# EAGLE design PortArrayModule_v2 (EAGLE 9.6.2)
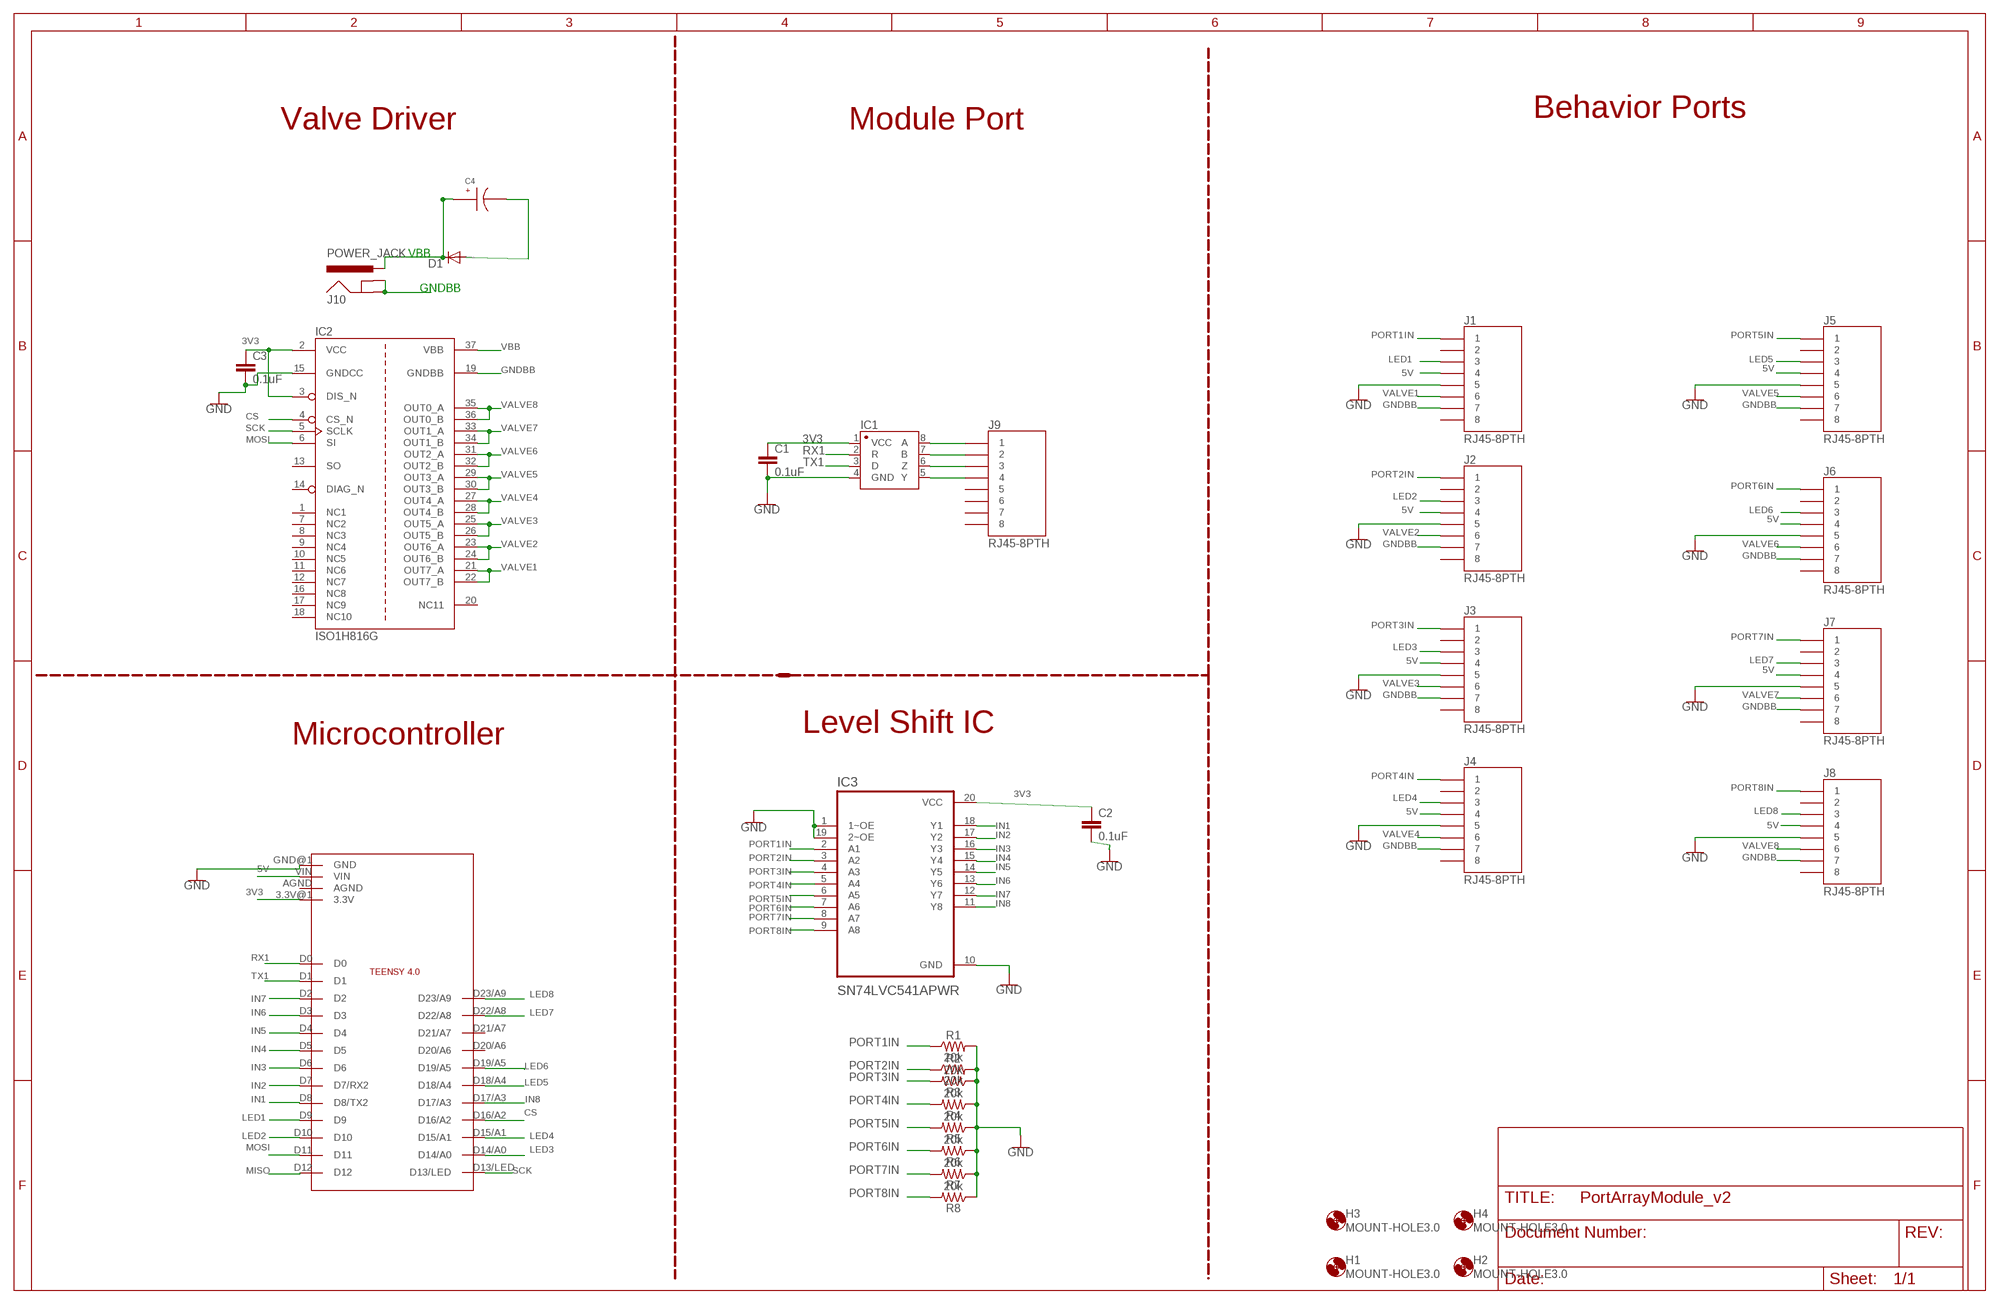
[diagram p0: schematic, sheet 1]

## Parts
C1  0.1uF  1.0UF-0805-25V-10%  [0805]
C2  0.1uF  1.0UF-0805-25V-10%  [0805]
C3  0.1uF  1.0UF-0805-25V-10%  [0805]
C4  EEE-FK1H100UR  [EEE-FK1H100UR]
D1  DIODE-DO214AA  [DO214AA]
H1  MOUNT-HOLE3.0  [3,0]
H2  MOUNT-HOLE3.0  [3,0]
H3  MOUNT-HOLE3.0  [3,0]
H4  MOUNT-HOLE3.0  [3,0]
IC1  SN65HVD31DR  [SO08]
IC2  ISO1H816G  [SOP65P1420X350-37N-1-V]
IC3  SN74LVC541APWR  [SOP65P640X120-20N]
J1  RJ45-8PTH  [RJ45-8]
J2  RJ45-8PTH  [RJ45-8]
J3  RJ45-8PTH  [RJ45-8]
J4  RJ45-8PTH  [RJ45-8]
J5  RJ45-8PTH  [RJ45-8]
J6  RJ45-8PTH  [RJ45-8]
J7  RJ45-8PTH  [RJ45-8]
J8  RJ45-8PTH  [RJ45-8]
J9  RJ45-8PTH  [RJ45-8]
J10  POWER_JACK  [POWER_JACK_PTH]
MC1  TEENSY4.0_SIMPLE_NO_VUSB  [TEENSY4.0_SIMPLE_NO_VUSB]
R1  20k  RESISTOR0805  [0805]
R2  20k  RESISTOR0805  [0805]
R3  20k  RESISTOR0805  [0805]
R4  20k  RESISTOR0805  [0805]
R5  20k  RESISTOR0805  [0805]
R6  20k  RESISTOR0805  [0805]
R7  20k  RESISTOR0805  [0805]
R8  20k  RESISTOR0805  [0805]

## Nets
3V3: C1.1 C2.1 C3.1 IC1.1(VCC) IC2.2(VCC) IC2.3(DIS_N) IC3.20(VCC) MC1.3.3V@1(3.3V)
5V: J1.4 J2.4 J3.4 J4.4 J5.4 J6.4 J7.4 J8.4 MC1.VIN
CS: IC2.4(CS_N) MC1.D16/A2
GND: C1.2 C2.2 C3.2 IC1.4(GND) IC2.15(GNDCC) IC3.1(1~OE) IC3.10(GND) IC3.19(2~OE) J1.5 J2.5 J3.5 J4.5 J5.5 J6.5 J7.5 J8.5 MC1.GND@1(GND) R1.2 R2.2 R3.1 R4.1 R5.1 R6.1 R7.1 R8.1
GNDBB: C4.CATHODE D1.A IC2.19(GNDBB) J1.7 J2.7 J3.7 J4.7 J5.7 J6.7 J7.7 J8.7 J10.GND J10.GNDBREAK
IN1: IC3.18(Y1) MC1.D8(D8/TX2)
IN2: IC3.17(Y2) MC1.D7(D7/RX2)
IN3: IC3.16(Y3) MC1.D6
IN4: IC3.15(Y4) MC1.D5
IN5: IC3.14(Y5) MC1.D4
IN6: IC3.13(Y6) MC1.D3
IN7: IC3.12(Y7) MC1.D2
IN8: IC3.11(Y8) MC1.D17/A3
LED1: J1.3 MC1.D9
LED2: J2.3 MC1.D10
LED3: J3.3 MC1.D14/A0
LED4: J4.3 MC1.D15/A1
LED5: J5.3 MC1.D18/A4
LED6: J6.3 MC1.D19/A5
LED7: J7.3 MC1.D22/A8
LED8: J8.3 MC1.D23/A9
MISO: MC1.D12
MOSI: IC2.6(SI) MC1.D11
N$6: IC1.6(Z) J9.3
N$7: IC1.5(Y) J9.4
N$8: IC1.8(A) J9.1
N$9: IC1.7(B) J9.2
PORT1IN: IC3.2(A1) J1.1 R1.1
PORT2IN: IC3.3(A2) J2.1 R2.1
PORT3IN: IC3.4(A3) J3.1 R3.2
PORT4IN: IC3.5(A4) J4.1 R4.2
PORT5IN: IC3.6(A5) J5.1 R5.2
PORT6IN: IC3.7(A6) J6.1 R6.2
PORT7IN: IC3.8(A7) J7.1 R7.2
PORT8IN: IC3.9(A8) J8.1 R8.2
RX1: IC1.2(R) MC1.D0
SCK: IC2.5(SCLK) MC1.D13/LED
TX1: IC1.3(D) MC1.D1
VALVE1: IC2.21(OUT7_A) IC2.22(OUT7_B) J1.6
VALVE2: IC2.23(OUT6_A) IC2.24(OUT6_B) J2.6
VALVE3: IC2.25(OUT5_A) IC2.26(OUT5_B) J3.6
VALVE4: IC2.27(OUT4_A) IC2.28(OUT4_B) J4.6
VALVE5: IC2.29(OUT3_A) IC2.30(OUT3_B) J5.6
VALVE6: IC2.31(OUT2_A) IC2.32(OUT2_B) J6.6
VALVE7: IC2.33(OUT1_A) IC2.34(OUT1_B) J7.6
VALVE8: IC2.35(OUT0_A) IC2.36(OUT0_B) J8.6
VBB: C4.ANODE D1.C IC2.37(VBB) J10.PWR
Unconnected: IC2.1(NC1) IC2.7(NC2) IC2.8(NC3) IC2.9(NC4) IC2.10(NC5) IC2.11(NC6) IC2.12(NC7) IC2.13(SO) IC2.14(DIAG_N) IC2.16(NC8) IC2.17(NC9) IC2.18(NC10) IC2.20(NC11) J1.2 J1.8 J2.2 J2.8 J3.2 J3.8 J4.2 J4.8 J5.2 J5.8 J6.2 J6.8 J7.2 J7.8 J8.2 J8.8 J9.5 J9.6 J9.7 J9.8 MC1.AGND MC1.D20/A6 MC1.D21/A7

## Notes on the sheet
- Behavior Ports
- Valve Driver | Module Port
- VBB
- GNDBB
- Level Shift IC
- Microcontroller

## Library data of the parts
C1-C3 = SparkFun-Capacitors:1.0UF: 1µF ceramic capacitors A capacitor is a passive two-terminal electrical component used to store electrical energy temporarily in an electric field.; PROD_ID: CAP-08064; VALUE: 1.0uF
C4 = JoshParts10:EEE-FK1H100UR
D1 = diode:DIODE-: DIODE
H1-H4 = holes:MOUNT-HOLE: MOUNTING HOLE with drill center marker
IC1 = Joshparts4:SN65HVD31DR: A placeholder for generic narrow & wide SOIC8 foorptints - used on the DIP adapter board.
IC2 = ISO1H816G:ISO1H816G: ISO1H816G Galvanic Isolated 8 Channel 1.2A High-Side Switch SOP65P1420X350-37N-1-V
IC3 = SN74LVC541APWR:SN74LVC541APWR
J1-J9 = SparkFun:RJ45-8: RJ45 Jack Simple RJ45, 8-pin connection - connector for common Cat5, Cat5e, and Cat6 Ethernet cables. Footprint not yet proven in production. Connector sku is PRT-00643; Breakout PCB sku is BOB-00716.
J10 = SparkFun-Connectors:POWER_JACK: Power Jack Connector This is the standard 5.5mm barrel jack for power. The PTH is the most common, proven, reliable, footprint. The Slot footprint only works if the mill layer is transmitted to the PCB fab house so be warned. Here are the connectors we sell at SparkFun: DC Barrel Power Jack/Connector <https://www.sparkfun.com/products/119> (PRT-00119) DC Barrel Power Jack/Connector (SMD) <https://www.sparkfun.com/products/12748> (PRT-12748) DC Barrel Jack Adapter - Breadboard Compatible <https://www.sparkfun.com/products/10811> (PRT-10811) It is used on this SparkFun product (and many, many others): SparkFun RedBoard - Programmed with Arduino <https://www.sparkfun.com/products/12757> (DEV-12757) Also, if you need a mating power supply or connector, please check these out: Wall Adapter Power Supply - 9VDC 650mA <https://www.sparkfun.com/products/298> (TOL-00298) DC Barrel Jack Adapter - Male <https://www.sparkfun.com/products/10287> (PRT-10287); PROD_ID: CONN-08197
MC1 = Teensy4.0_SIMPLE_N_VUSB:TEENSY4.0_SIMPLE_NO_VUSB: Tennsy 4.0 simple layout (no underside pins or VUSB )
R1-R8 = SparkFun-Resistors:RESISTOR: Generic Resistor Package

## Board
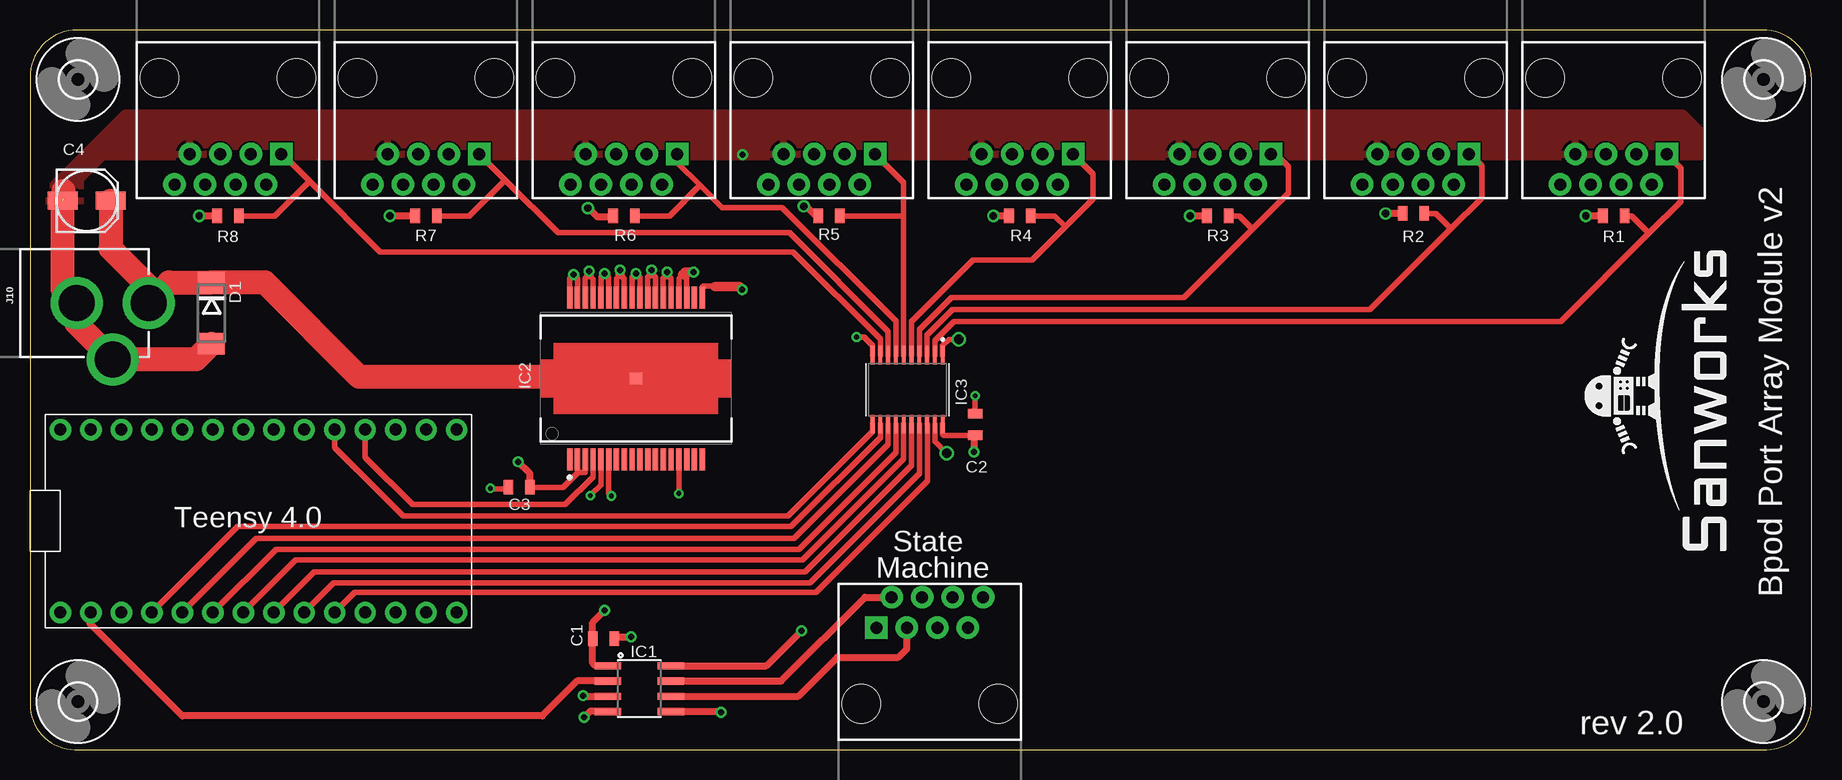
[diagram p1: board, top side]
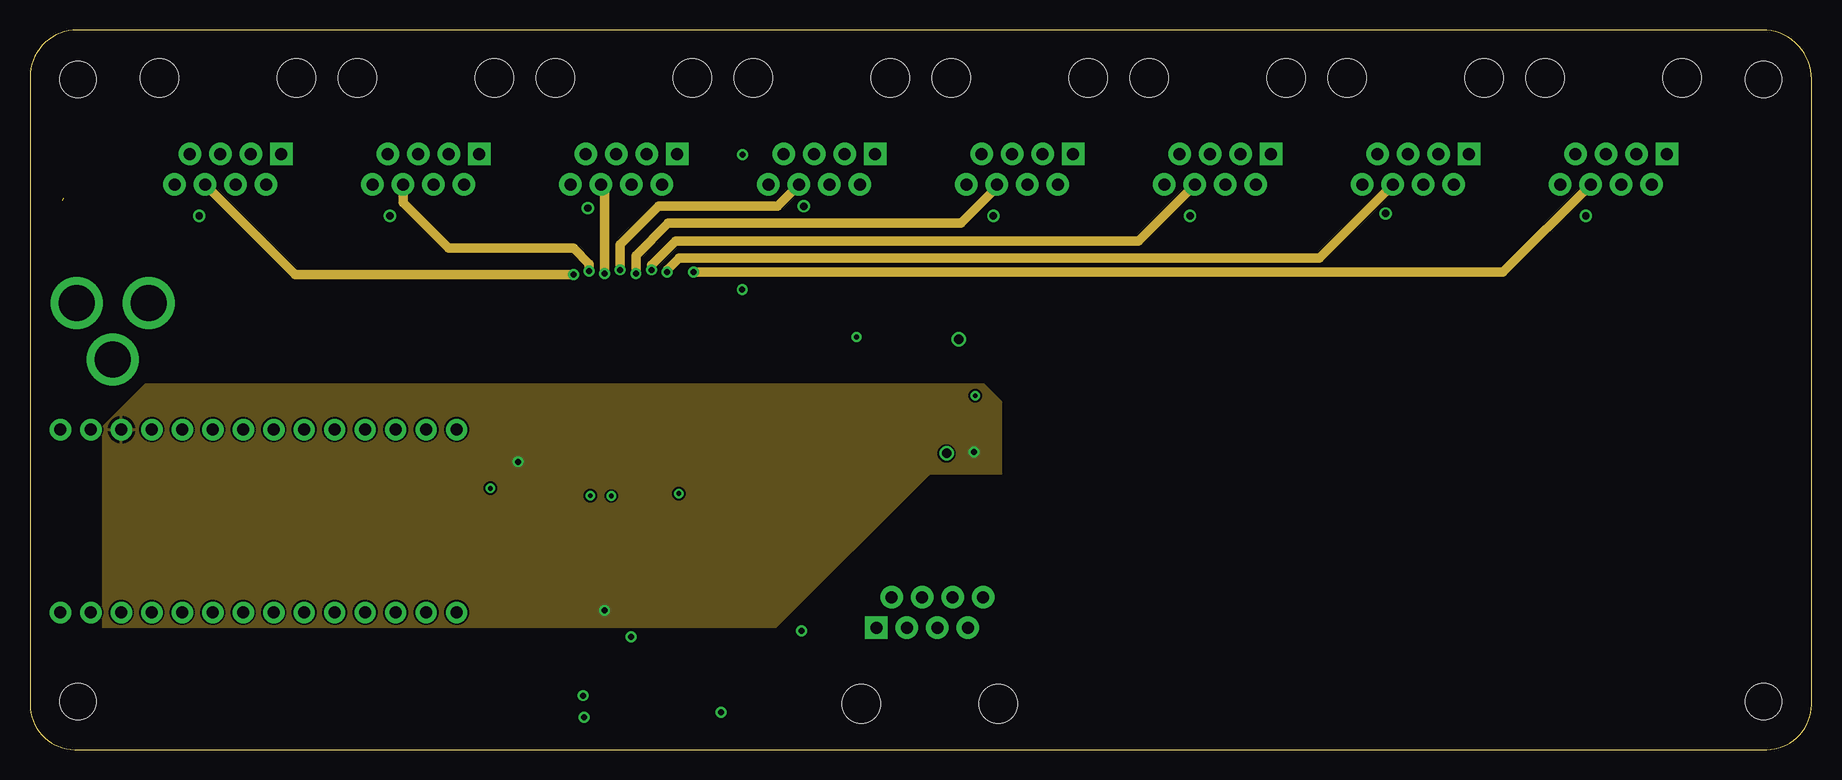
[diagram p2: board, inner layer Route2]
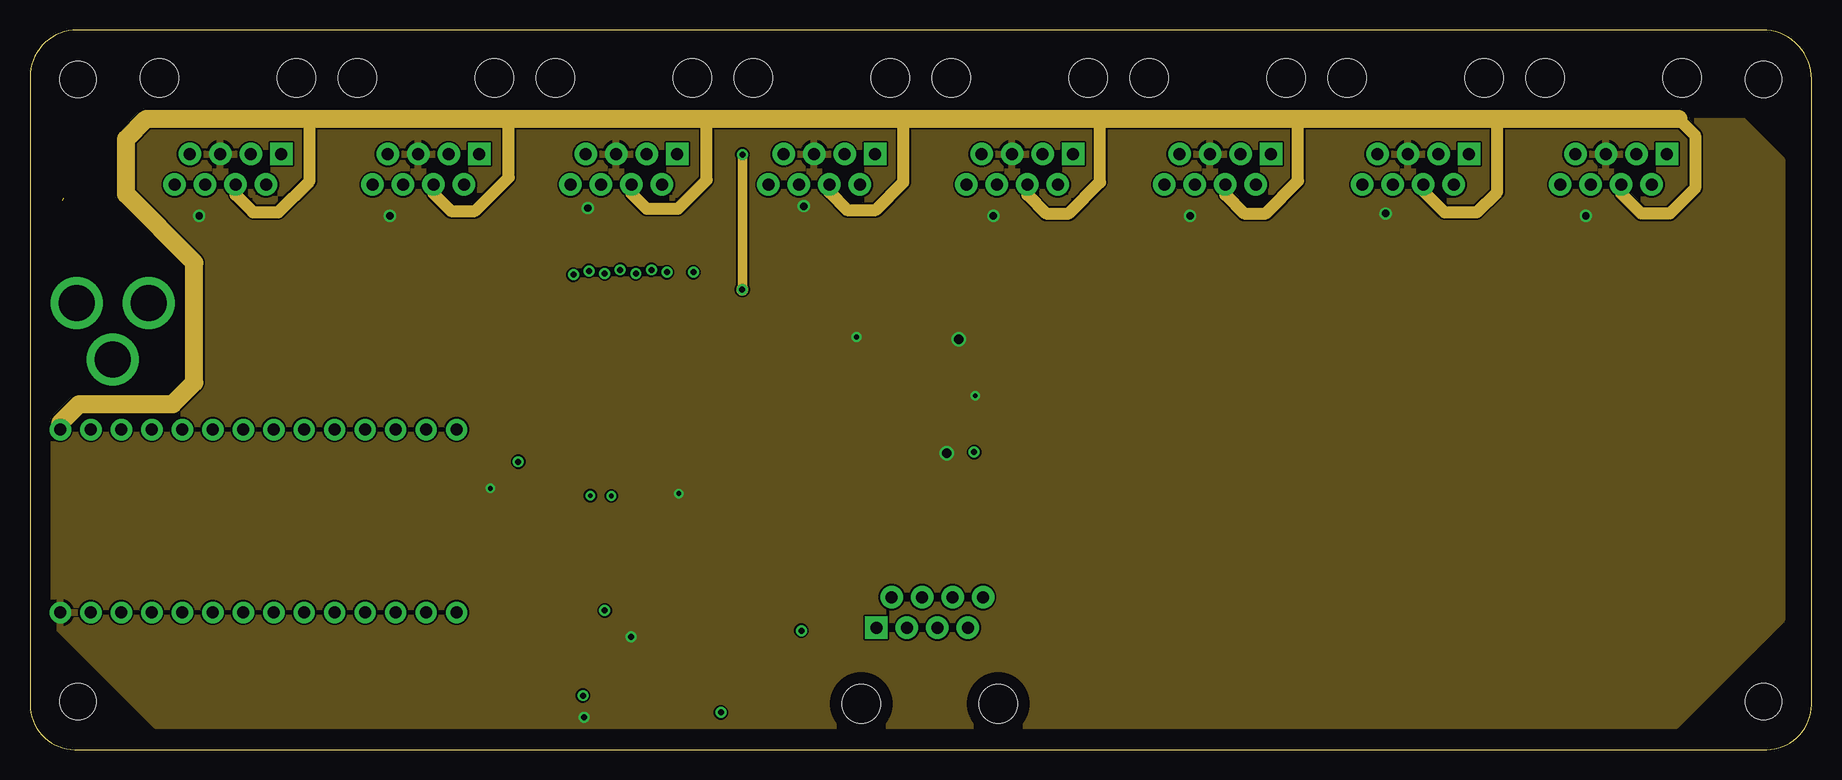
[diagram p3: board, inner layer Route15]
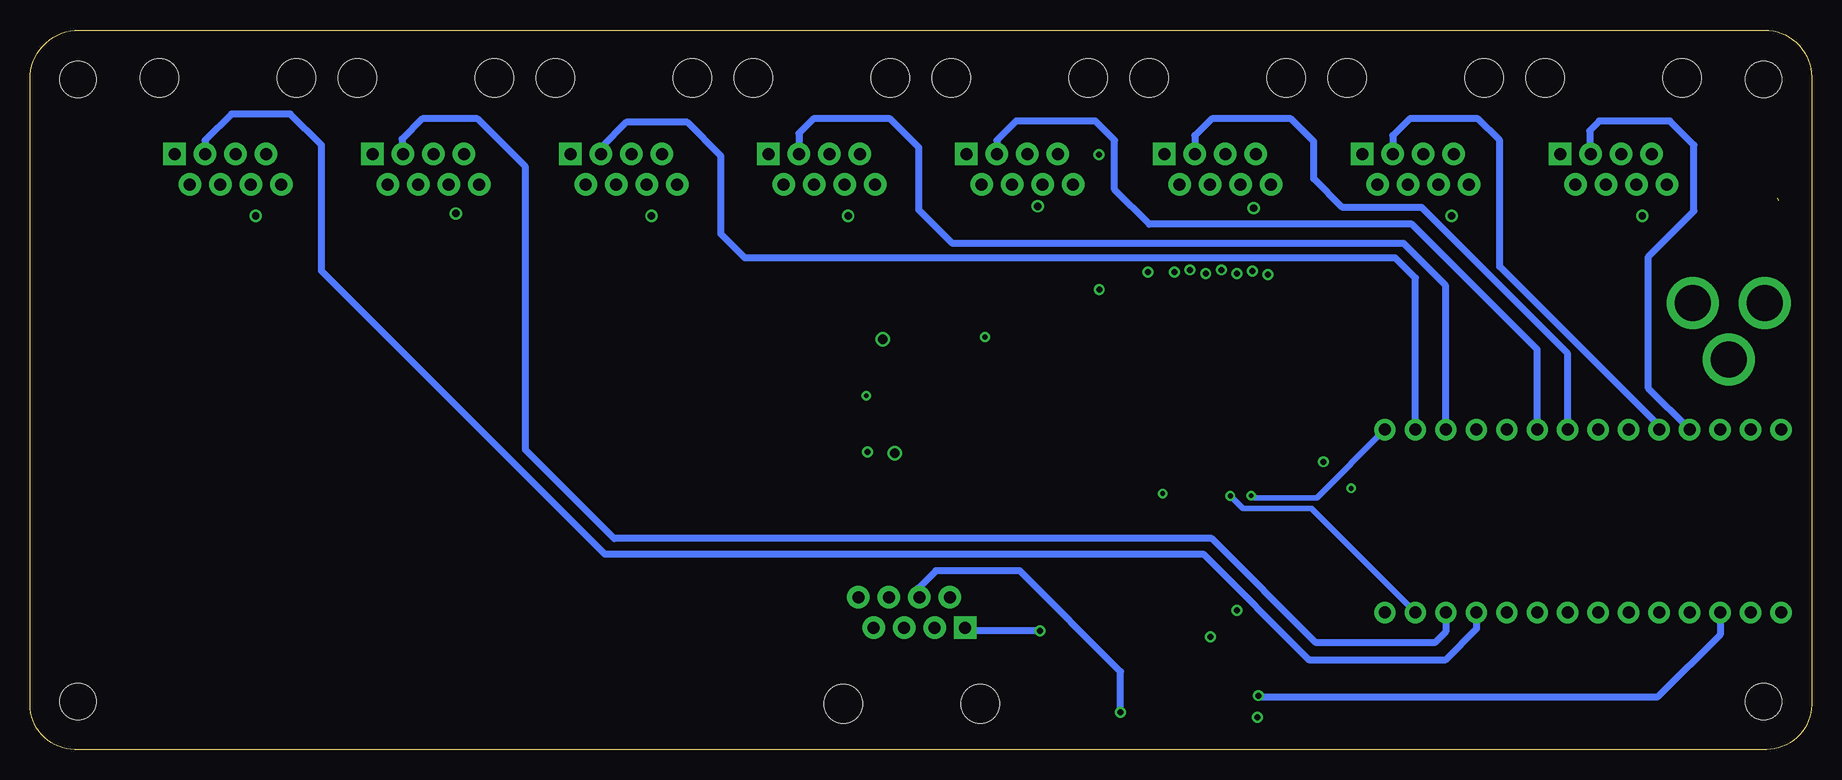
[diagram p4: board, bottom side, seen from below]

Size 148.5 x 60 mm. Coordinates in mm from the lower left corner, seen from the top.
Outline: 3.73,0 144.75,0 arc90 148.5,3.75 148.5,55.91 arc90 144.41,60 3.92,60 arc90 0,56.08 0,3.73 arc90 3.73,0
Copper layers (1+2*15+16): Top 0.035mm / dielectric 1.5mm / Route2 0.035mm / dielectric 0.15mm / Route15 0.035mm / dielectric 0.2mm / Bottom 0.035mm
Design rules "default *": minimum track width 6mil, minimum drill 0.35mm, track to track 6mil, track to pad 6mil, pad to pad 6mil, via to via 6mil, smd to smd 6mil, copper to edge 40mil, drill to drill 6mil, minimum pad ring 10mil, minimum via ring 8mil, stop-mask expansion 4mil, vias tented up to drill 0mil, thermal gap 10mil

### Footprints (pad centres in the part's own frame; a part is rotated, then mirrored left to right if it is on the bottom)
0805 = smd 0.8 x 1.2: 1 -0.9,0; 2 0.9,0
EEE-FK1H100UR = smd 1.5 x 2.5: ANODE 0,4; CATHODE 0,0
DO214AA = smd 1.8 x 2.2: A 2.55,0; C -2.55,0
3,0 = hole 3: 0,0
SO08 = smd 0.61 x 2.21: 1 -1.905,-2.616; 2 -0.635,-2.616; 3 0.635,-2.616; 4 1.905,-2.616; 5 1.905,2.616; 6 0.635,2.616; 7 -0.635,2.616; 8 -1.905,2.616
SOP65P1420X350-37N-1-V = smd 1.83 x 0.45: 1 -6.74,5.525; 2 -6.74,4.875; 3 -6.74,4.225; 4 -6.74,3.575; 5 -6.74,2.925; 6 -6.74,2.275; 7 -6.74,1.625; 8 -6.74,0.975; 9 -6.74,0.325; 10 -6.74,-0.325; 11 -6.74,-0.975; 12 -6.74,-1.625; 13 -6.74,-2.275; 14 -6.74,-2.925; 15 -6.74,-3.575; 16 -6.74,-4.225; 17 -6.74,-4.875; 18 -6.74,-5.525; 19 6.74,-5.525; 20 6.74,-4.875; 21 6.74,-4.225; 22 6.74,-3.575; 23 6.74,-2.925; 24 6.74,-2.275; 25 6.74,-1.625; 26 6.74,-0.975; 27 6.74,-0.325; 28 6.74,0.325; 29 6.74,0.975; 30 6.74,1.625; 31 6.74,2.275; 32 6.74,2.925; 33 6.74,3.575; 34 6.74,4.225; 35 6.74,4.875; 36 6.74,5.525 | smd 1 x 1: 37 0,0
SOP65P640X120-20N = smd 1.57 x 0.41: 1 -2.87,2.925; 2 -2.87,2.275; 3 -2.87,1.625; 4 -2.87,0.975; 5 -2.87,0.325; 6 -2.87,-0.325; 7 -2.87,-0.975; 8 -2.87,-1.625; 9 -2.87,-2.275; 10 -2.87,-2.925; 11 2.87,-2.925; 12 2.87,-2.275; 13 2.87,-1.625; 14 2.87,-0.975; 15 2.87,-0.325; 16 2.87,0.325; 17 2.87,0.975; 18 2.87,1.625; 19 2.87,2.275; 20 2.87,2.925
RJ45-8 = drill 1 pad 1.88 square: 1 -4.445,6.35 | drill 1 pad 1.88: 2 -3.175,8.89; 3 -1.905,6.35; 4 -0.635,8.89; 5 0.635,6.35; 6 1.905,8.89; 7 3.175,6.35; 8 4.445,8.89 | hole 3.2: -5.715,0; 5.715,0
POWER_JACK_PTH = drill 2.997 pad 4.318: GND 0,7.7; GNDBREAK 4.7,10.7; PWR 0,13.7
TEENSY4.0_SIMPLE_NO_VUSB = drill 1 pad 1.778: 3.3V@1 7.62,10.16; AGND 7.62,12.7; D0 -7.62,12.7; D1 -7.62,10.16; D2 -7.62,7.62; D3 -7.62,5.08; D4 -7.62,2.54; D5 -7.62,0; D6 -7.62,-2.54; D7 -7.62,-5.08; D8 -7.62,-7.62; D9 -7.62,-10.16; D10 -7.62,-12.7; D11 -7.62,-15.24; D12 -7.62,-17.78; D13/LED 7.62,-17.78; D14/A0 7.62,-15.24; D15/A1 7.62,-12.7; D16/A2 7.62,-10.16; D17/A3 7.62,-7.62; D18/A4 7.62,-5.08; D19/A5 7.62,-2.54; D20/A6 7.62,0; D21/A7 7.62,2.54; D22/A8 7.62,5.08; D23/A9 7.62,7.62; GND@1 -7.62,15.24; VIN 7.62,15.24

### Placement (x,y rotation side)
C1  47.8,9.26 0 top
C2  78.79,27.11 90 top
C3  40.78,21.86 180 top
C4  2.72,45.76 270 top
D1  15.14,36.39 270 top
H1  4,55.88 0 top
H2  144.5,55.88 0 top
H3  144.5,4 0 top
H4  4,4 0 top
IC1  50.8,5.08 270 top
IC2  50.51,30.94 90 top
IC3  73.15,30 270 top
J1  132,56 180 top
J2  115.5,56 180 top
J3  99,56 180 top
J4  82.5,56 180 top
J5  66,56 180 top
J6  49.5,56 180 top
J7  33,56 180 top
J8  16.5,56 180 top
J9  75,3.81 0 top
J10  -3.81,37.23 270 top
MC1  17.78,19.05 90 top
R1  132,44.5 180 top
R2  115.3,44.7 180 top
R3  99,44.5 0 top
R4  82.5,44.5 0 top
R5  66.6,44.5 0 top
R6  49.5,44.5 0 top
R7  33,44.5 0 top
R8  16.5,44.5 0 top
U$1  [SANWORKS_LOGO]  141.62,16.3 90 top

### Tracks (layer width: path | path; a pad name or v marks a point on that pad's centre or on a via)
3V3  (via drill 0.5)
  Top 0.45: IC3.20 76.08,26.32 76.2,26.2 C2.1 | IC2.2 45.63,23.07 | 45.63,23.07 45.7,23.14 45.74,23.1 46.28,23.1 IC2.3 | 45.63,23.07 44.44,21.87 C3.1
  Top 0.6: C3.1 41.68,23.02 v40.7,24 | C2.1 78.7,26.12 v78.7,24.8 | v47.9,11.6 46.9,10.6 C1.1 46.9,7.2 47.12,6.99 IC1.1
  pour Route2: 6,26.9 6,10.2 62.2,10.2 75,23 81,23 81,29 79.5,30.5 9.6,30.5
5V
  Route15 1: 137.4,52.6 138.8,51.2 138.8,46.8 136.7,44.7 134.3,44.7 132.63,46.37 J1.4 | J8.4 17.14,46.27 18.6,44.8 20.7,44.8 23.3,47.4 23.3,52.6 | J7.4 33.63,46.37 35.1,44.9 37.1,44.9 39.9,47.7 39.9,52.6 | J6.4 50.13,46.37 51.4,45.1 54,45.1 56.4,47.5 56.4,52.6 | J5.4 66.64,46.47 68.1,45 70.5,45 72.8,47.3 72.8,52.6 | J4.4 83.14,46.27 84.7,44.7 86.6,44.7 89.2,47.3 89.2,52.6 | J3.4 99.64,46.27 101.2,44.7 103,44.7 105.7,47.4 105.7,52.6 | J2.4 116.14,46.56 117.9,44.8 120.6,44.8 122.3,46.5 122.3,52.6
  Route15 1.5: MC1.VIN 2.54,27.24 4.1,28.8 11.9,28.8 13.7,30.6 13.7,40.6 8,46.3 8,50.9 9.7,52.6 23.3,52.6 39.9,52.6 56.4,52.6 72.8,52.6 89.2,52.6 105.7,52.6 122.3,52.6 137.4,52.6
CS
  Top 0.45: MC1.D16/A2 27.94,24.36 31.88,20.42 44.62,20.42 46.94,22.73 IC2.4
GND  (via drill 0.4, 0.5, 0.6, 0.8)
  Top 0.45: IC3.10 70.22,33.67 69.5,34.4 v68.9,34.4 | C2.2 v78.79,29.49 v78.8,29.5 | IC2.15 54.09,21.45 54.2,21.34 v54.09,21.34 | 54.12,21.32 v54.09,21.34 | v54.09,21.34 | C3.2 39.77,21.75 38.41,21.75 v38.38,21.78 | IC3.1 76.08,33.67 76.6,34.2 v77.4,34.2 | IC3.19 75.42,25.68 v76.4,24.7
  Top 0.6: v50.1,9.4 50.06,9.36 48.8,9.36 C1.2 | IC1.4 46.67,3.17 v46.2,2.7 | R8.1 v14.1,44.5 | R1.2 v129.7,44.5 | R2.2 v113,44.7 | R3.1 v96.7,44.5 | R4.1 v80.3,44.5 | R6.1 48.5,44.4 47.3,44.4 46.54,45.16 v46.5,45.16 | R7.1 v30,44.5 | R5.1 65.5,44.5 64.7,45.3 v64.5,45.3
  pour Route15: 2,10.5 2,50.7 3.7,52.4 142.8,52.4 146,49.2 146,10.8 137.2,2 10.5,2
GNDBB  (via drill 0.5)  (1 unrouted)
  Top 0.45: IC2.19 56.03,38.53 56.13,38.63 57.07,38.63 57.11,38.59
  Top 0.8: v59.37,38.36 59.14,38.59 57.11,38.59
  Top 2: D1.A 13.83,32.53 J10.GNDBREAK 3.89,35.53 J10.GND 2.72,38.4 C4.CATHODE | 2.8,46 2.8,46.6
  Route15 0.8: v59.39,49.61 59.39,38.34
  Route15 1: 59.39,38.34 | 59.39,38.34 v59.37,38.36
  pour Top: 1.6,45.2 1.6,46.8 7.9,53.1 137.8,53.1 139.3,51.6 139.3,49.4 6.1,49.4 4.2,47.5 4.2,45.2
IN1
  Top 0.45: MC1.D8 27.07,13.1 65.5,13.1 74.8,22.4 74.8,27.11 IC3.18
IN2
  Top 0.45: MC1.D7 25.33,13.9 65,13.9 74.12,23.02 IC3.17
IN3
  Top 0.45: MC1.D6 23.69,14.8 64.6,14.8 73.47,23.68 IC3.16
IN4
  Top 0.45: MC1.D5 22.15,15.8 64.4,15.8 72.83,24.23 IC3.15
IN5
  Top 0.45: MC1.D4 20.51,16.7 64.1,16.7 72.17,24.77 IC3.14
IN6
  Top 0.45: MC1.D3 18.87,17.6 63.7,17.6 71.53,25.43 IC3.13
IN7
  Top 0.45: MC1.D2 17.33,18.6 63.45,18.6 70.88,26.03 IC3.12
IN8
  Top 0.45: IC3.11 70.22,26.53 63.2,19.5 31.1,19.5 25.4,25.2 MC1.D17/A3
LED1
  Bottom 0.6: J1.3 133.91,50.8 131.7,53 126.8,53 124.2,50.4 124.2,39.9 100.6,16.3 50.7,16.3 41.9,7.5 30.5,7.5 27.9,10.1 27.9,11.39 MC1.D9
LED2
  Bottom 0.6: MC1.D10 30.48,9.82 31.4,8.9 41.3,8.9 50,17.6 99.8,17.6 107.2,25 107.2,48.6 111.2,52.6 115.8,52.6 117.5,50.9 117.5,49.74 J2.3
LED3
  Bottom 0.6: MC1.D14/A0 33.02,39.32 34.7,41 88.9,41 90.9,43 90.9,49.5 93.7,52.3 98.8,52.3 100.91,50.2 J3.3
LED4
  Bottom 0.6: MC1.D15/A1 30.48,38.68 34,42.2 71.6,42.2 74.4,45 74.4,50.2 76.8,52.6 83.2,52.6 84.41,51.4 J4.3
LED5
  Bottom 0.6: MC1.D18/A4 22.86,33.36 33.3,43.8 55.2,43.8 58.1,46.7 58.1,50.8 59.7,52.4 66.3,52.4 67.91,50.8 J5.3
LED6
  Bottom 0.6: MC1.D19/A5 20.32,33.02 32.5,45.2 39.1,45.2 41.5,47.6 41.5,50.7 43.4,52.6 50,52.6 51.41,51.2 J6.3
LED7
  Bottom 0.6: MC1.D22/A8 12.7,26.97 26,40.27 26,50.8 27.8,52.6 33.5,52.6 34.91,51.2 J7.3
LED8
  Bottom 0.6: MC1.D23/A9 13.6,30.11 13.6,41.1 9.8,44.9 9.8,50.4 11.8,52.4 17.7,52.4 18.5,51.6 18.5,49.74 J8.3
MOSI  (via drill 0.4)
  Top 0.45: v48.45,21.15 48.24,21.36 IC2.6
  Bottom 0.45: MC1.D11 41.69,20.1 47.4,20.1 v48.45,21.15
N$6
  Top 0.6: IC1.6 64.05,4.45 67.3,7.7 72.4,7.7 73.09,8.39 J9.3
N$7  (via drill 0.5)
  Top 0.6: IC1.5 57.52,3.17 v57.6,3.1
  Bottom 0.6: v57.6,3.1 57.6,6.5 66,14.9 73,14.9 74.4,13.5 74.4,12.73 J9.4
N$8  (via drill 0.5)
  Top 0.6: IC1.8 61.38,6.99 v64.3,9.9
  Bottom 0.6: v64.3,9.9 70.3,9.9 J9.1
N$9
  Top 0.6: IC1.7 62.62,5.71 69.6,12.7 J9.2
PORT1IN
  Top 0.45: IC3.2 75.42,34.12 77,35.7 127.6,35.7 134.95,43.05 | 134.95,43.05 137.6,45.7 137.6,48.49 J1.1 | R1.1 133.5,44.5 134.95,43.05
PORT2IN
  Top 0.45: IC3.3 74.78,34.58 76.9,36.7 111.7,36.7 118.45,43.45 | 118.45,43.45 121,46 121,48.7 120.05,49.65 J2.1 | R2.1 117.2,44.7 118.45,43.45
PORT3IN
  Top 0.45: IC3.4 74.12,35.02 76.8,37.7 96.2,37.7 101.9,43.4 | 101.9,43.4 104.9,46.4 104.9,48.6 103.85,49.65 J3.1 | R3.2 100.8,44.5 101.9,43.4
PORT4IN
  Top 0.45: IC3.5 73.47,35.67 78.6,40.8 83.5,40.8 86.3,43.6 | 86.3,43.6 88.6,45.9 88.6,48 J4.1 | R4.2 85.4,44.5 86.3,43.6
PORT5IN
  Top 0.45: IC3.6 72.83,44.4 | 72.83,44.4 72.83,47.27 J5.1 | R5.2 72.72,44.5 72.83,44.4
PORT6IN
  Top 0.45: IC3.7 72.17,35.73 62.7,45.2 57.7,45.2 55.85,47.05 | 55.85,47.05 53.95,48.95 J6.1 | R6.2 53.3,44.5 55.85,47.05
PORT7IN
  Top 0.45: IC3.8 71.53,34.88 63.3,43.1 44,43.1 39.6,47.5 | 39.6,47.5 J7.1 | R7.2 36.6,44.5 39.6,47.5
PORT8IN
  Top 0.45: IC3.9 70.88,34.23 63.6,41.5 29.2,41.5 23.3,47.4 | 23.3,47.4 21.05,49.65 J8.1 | R8.2 20.4,44.5 23.3,47.4
RX1
  Top 0.6: IC1.2 45.62,5.71 42.7,2.8 12.7,2.8 5,10.5 5,11.35 MC1.D0
SCK  (via drill 0.4)
  Top 0.45: IC2.5 47.59,22.07 46.79,21.27 46.79,21.25 v46.71,21.17
  Bottom 0.45: v46.71,21.17 46.63,21.17 46.44,20.98 41.25,20.98 MC1.D13/LED
TX1  (via drill 0.5)
  Top 0.6: v46.1,4.5 46.16,4.45 IC1.3
  Bottom 0.6: MC1.D1 7.62,9.58 12.8,4.4 46,4.4 v46.1,4.5
VALVE1  (via drill 0.5)
  Top 0.45: IC2.22 54.09,39.28 54.4,39.6 54.73,39.27 IC2.21
  Top 0.8: v55.3,39.8 54.6,39.8 54.4,39.6
  Route2 0.8: J1.6 122.78,39.8 v55.3,39.8
VALVE2  (via drill 0.5)
  Top 0.45: IC2.24 52.78,39.28 53.1,39.6 53.44,39.27 IC2.23
  Top 0.8: v53.1,39.8 53.1,39.6
  Route2 0.8: J2.6 107.48,41 54.1,41 53.1,40 v53.1,39.8
VALVE3  (via drill 0.5)
  Top 0.45: IC2.26 51.48,39.38 51.8,39.7 52.13,39.37 IC2.25
  Top 0.8: v51.8,40 51.8,39.7
  Route2 0.8: J3.6 92.39,42.4 53.8,42.4 51.8,40.4 v51.8,40
VALVE4  (via drill 0.5)
  Top 0.45: IC2.28 50.19,39.38 v50.5,39.7 50.84,39.37 IC2.27
  Route2 0.8: J4.6 80.59,46.9 77.6,43.9 53.2,43.9 50.5,41.2 v50.5,39.7
VALVE5  (via drill 0.5)
  Top 0.45: IC2.30 48.88,39.28 49.2,39.6 49.53,39.27 IC2.29
  Top 0.8: v49.2,40 49.2,39.6
  Route2 0.8: J5.6 64.09,47.09 62.3,45.3 52.4,45.3 49.2,42.1 v49.2,40
VALVE6  (via drill 0.5)
  Top 0.45: IC2.32 47.59,39.38 v47.9,39.7 48.23,39.37 IC2.31
  Route2 0.8: J6.6 47.9,46.8 v47.9,39.7
VALVE7  (via drill 0.5)
  Top 0.45: IC2.34 46.28,39.28 46.6,39.6 46.95,39.25 46.95,37.7 IC2.33
  Top 0.8: v46.6,39.9 46.6,39.6
  Route2 0.8: J7.6 31.09,45.6 34.9,41.8 45.3,41.8 46.6,40.5 v46.6,39.9
VALVE8  (via drill 0.5)
  Top 0.45: IC2.36 44.98,39.28 v45.3,39.6 45.63,39.27 IC2.35
  Route2 0.8: J8.6 22.11,39.6 v45.3,39.6
VBB
  Top 2: C4.ANODE 6.72,41.78 10.1,38.4 10.1,37.44 J10.PWR 11.6,38.94 D1.C 19.59,38.94 27.45,31.08 50.37,31.08 IC2.37

### Text on the board
tPlace: Teensy 4.0 | State | Machine | Bpod Port Array Module v2 | rev 2.0